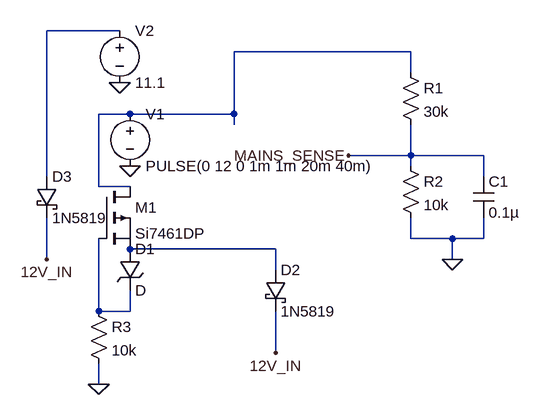
[diagram p0: schematic LTspice.asc]
LTspice.asc, the LTspice schematic file:
Version 4.1
SHEET 1 880 680
WIRE 128 -112 16 -112
WIRE 576 -80 304 -80
WIRE 576 -48 576 -80
WIRE 144 16 96 16
WIRE 304 16 304 -80
WIRE 304 16 144 16
WIRE 304 32 304 16
WIRE 576 80 576 32
WIRE 576 80 480 80
WIRE 688 80 576 80
WIRE 576 96 576 80
WIRE 16 112 16 -112
WIRE 688 112 688 80
WIRE 96 128 96 16
WIRE 144 128 96 128
WIRE 576 208 576 176
WIRE 640 208 576 208
WIRE 688 208 688 176
WIRE 688 208 640 208
WIRE 368 224 144 224
WIRE 16 240 16 176
WIRE 640 240 640 208
WIRE 368 256 368 224
WIRE 96 320 96 208
WIRE 144 320 144 288
WIRE 144 320 96 320
WIRE 368 384 368 320
WIRE 96 432 96 400
FLAG 144 96 0
FLAG 128 -32 0
FLAG 16 240 12V_IN
FLAG 640 240 0
FLAG 480 80 MAINS_SENSE
FLAG 96 432 0
FLAG 368 384 12V_IN
SYMBOL pmos 96 128 R0
SYMATTR InstName M1
SYMATTR Value Si7461DP
SYMBOL voltage 144 0 R0
WINDOW 123 0 0 Left 0
WINDOW 39 0 0 Left 0
SYMATTR InstName V1
SYMATTR Value PULSE(0 12 0 1m 1m 20m 40m)
SYMBOL zener 128 224 R0
SYMATTR InstName D1
SYMBOL schottky 0 112 R0
SYMATTR InstName D3
SYMATTR Value 1N5819
SYMATTR Description Diode
SYMATTR Type diode
SYMBOL voltage 128 -128 R0
WINDOW 123 0 0 Left 0
WINDOW 39 0 0 Left 0
SYMATTR InstName V2
SYMATTR Value 11.1
SYMBOL res 560 -64 R0
SYMATTR InstName R1
SYMATTR Value 30k
SYMBOL res 560 80 R0
SYMATTR InstName R2
SYMATTR Value 10k
SYMBOL cap 672 112 R0
SYMATTR InstName C1
SYMATTR Value 0.1µ
SYMBOL res 80 304 R0
SYMATTR InstName R3
SYMATTR Value 10k
SYMBOL schottky 352 256 R0
SYMATTR InstName D2
SYMATTR Value 1N5819
SYMATTR Description Diode
SYMATTR Type diode

The netlist it stands for:
* LTspice.asc
M1 N002 N004 N003 N003 Si7461DP
V1 N002 0 PULSE(0 12 0 1m 1m 20m 40m)
D1 N003 N004 D
D3 N001 12V_IN 1N5819
V2 N001 0 11.1
R1 N002 MAINS_SENSE 30k
R2 MAINS_SENSE 0 10k
C1 MAINS_SENSE 0 0.1µ
R3 N004 0 10k
D2 N003 12V_IN 1N5819
.model D D
.lib standard.dio
.model NMOS NMOS
.model PMOS PMOS
.lib standard.mos
.backanno
.end